# Altium schematic sheet Top_Sheet.SchDoc: =Projectname
size A4; DocumentNumber: 1; SheetNumber: 1; SheetTotal: 8
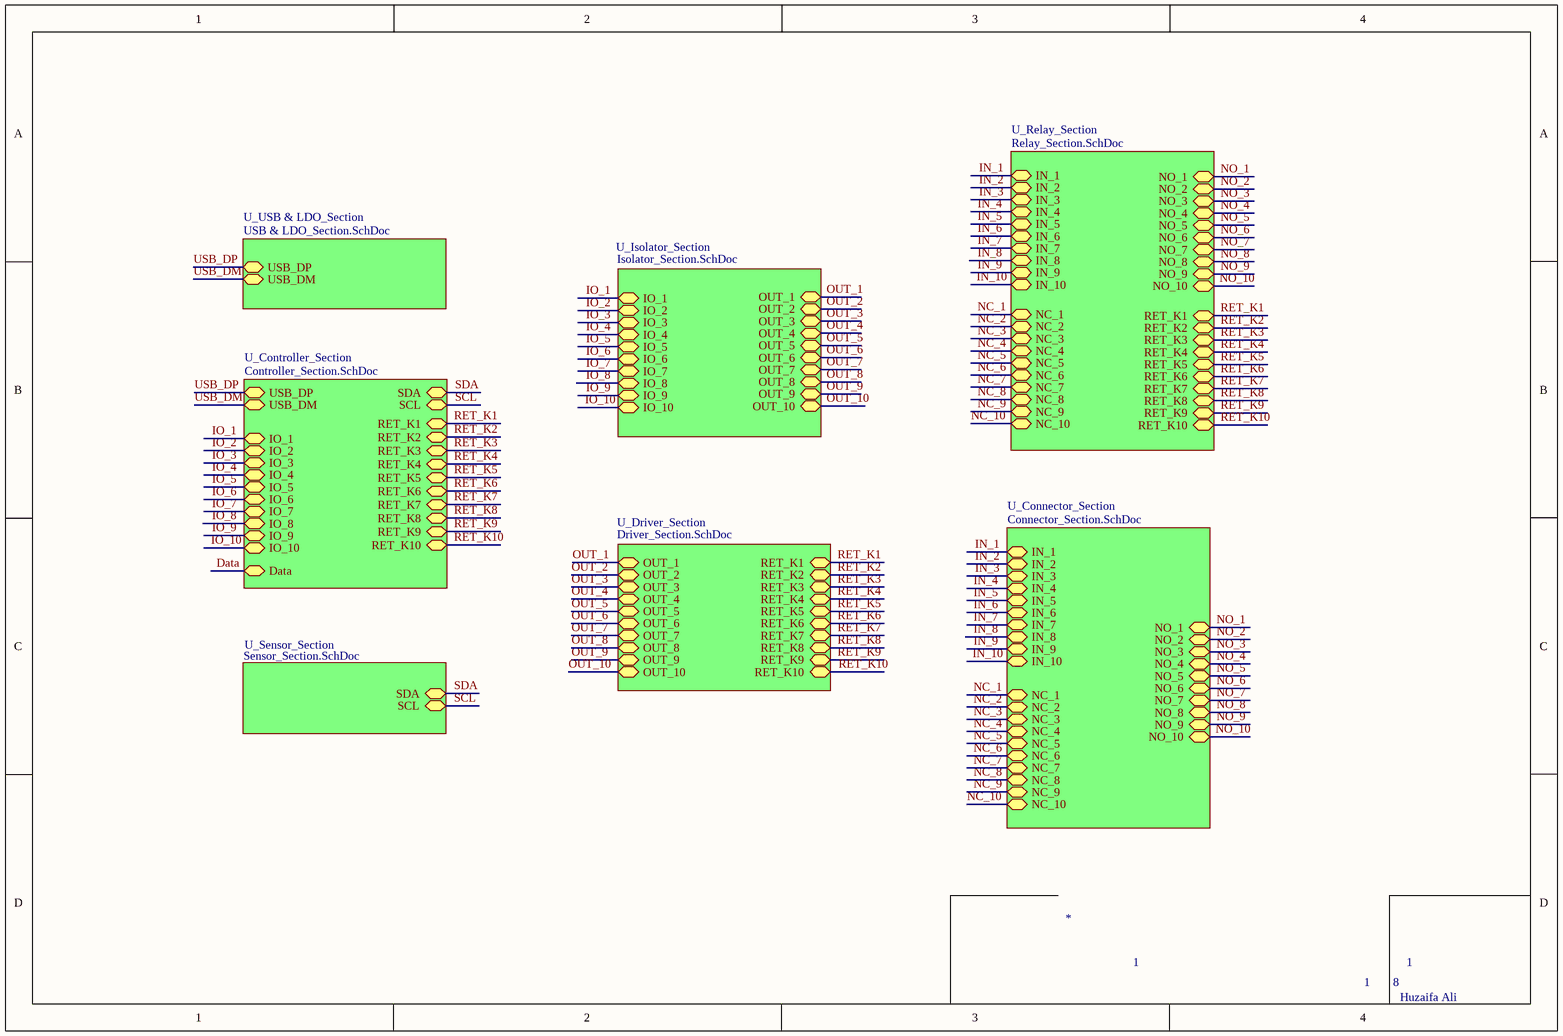
[diagram p0: Top_Sheet.SchDoc]

## Sub-sheets
U_Connector_Section = Connector_Section.SchDoc: IN_7 (bidir), NC_9 (bidir), NC_4 (bidir), NC_3 (bidir), NO_8 (bidir), NO_9 (bidir), NO_3 (bidir), IN_8 (bidir), NO_10 (bidir), NO_1 (bidir), NC_1 (bidir), NC_8 (bidir), NO_7 (bidir), IN_1 (bidir), NC_7 (bidir), NC_10 (bidir), NO_2 (bidir), IN_4 (bidir), NC_2 (bidir), NO_6 (bidir), IN_3 (bidir), IN_10 (bidir), NC_5 (bidir), IN_9 (bidir), IN_5 (bidir), NO_4 (bidir), NO_5 (bidir), IN_2 (bidir), IN_6 (bidir), NC_6 (bidir)
U_Controller_Section = Controller_Section.SchDoc: USB_DP (bidir), USB_DM (bidir), SDA (bidir), SCL (bidir), Data (bidir), IO_10 (bidir), IO_6 (bidir), IO_4 (bidir), IO_1 (bidir), IO_3 (bidir), IO_5 (bidir), IO_7 (bidir), IO_8 (bidir), IO_9 (bidir), IO_2 (bidir), RET_K10 (bidir), RET_K7 (bidir), RET_K9 (bidir), RET_K8 (bidir), RET_K2 (bidir), RET_K4 (bidir), RET_K1 (bidir), RET_K3 (bidir), RET_K6 (bidir), RET_K5 (bidir)
U_Driver_Section = Driver_Section.SchDoc: OUT_6 (bidir), OUT_7 (bidir), OUT_9 (bidir), OUT_1 (bidir), OUT_3 (bidir), OUT_8 (bidir), OUT_10 (bidir), OUT_5 (bidir), OUT_2 (bidir), OUT_4 (bidir), RET_K2 (bidir), RET_K1 (bidir), RET_K9 (bidir), RET_K10 (bidir), RET_K8 (bidir), RET_K7 (bidir), RET_K5 (bidir), RET_K6 (bidir), RET_K4 (bidir), RET_K3 (bidir)
U_Isolator_Section = Isolator_Section.SchDoc: OUT_10 (bidir), OUT_9 (bidir), OUT_6 (bidir), OUT_1 (bidir), OUT_2 (bidir), OUT_7 (bidir), OUT_8 (bidir), OUT_4 (bidir), OUT_3 (bidir), OUT_5 (bidir), IO_7 (bidir), IO_6 (bidir), IO_9 (bidir), IO_8 (bidir), IO_10 (bidir), IO_2 (bidir), IO_5 (bidir), IO_3 (bidir), IO_1 (bidir), IO_4 (bidir)
U_Relay_Section = Relay_Section.SchDoc: NO_10 (bidir), NC_8 (bidir), NC_2 (bidir), NC_10 (bidir), NC_3 (bidir), NC_4 (bidir), NC_7 (bidir), NC_9 (bidir), NC_6 (bidir), NC_5 (bidir), NO_7 (bidir), NO_8 (bidir), NO_9 (bidir), NO_6 (bidir), NC_1 (bidir), IN_1 (bidir), IN_2 (bidir), IN_3 (bidir), NO_2 (bidir), NO_1 (bidir), IN_10 (bidir), IN_9 (bidir), IN_8 (bidir), IN_7 (bidir), IN_6 (bidir), IN_5 (bidir), IN_4 (bidir), NO_3 (bidir), NO_5 (bidir), NO_4 (bidir), RET_K6 (bidir), RET_K1 (bidir), RET_K4 (bidir), RET_K3 (bidir), RET_K9 (bidir), RET_K10 (bidir), RET_K8 (bidir), RET_K2 (bidir), RET_K7 (bidir), RET_K5 (bidir)
U_Sensor_Section = Sensor_Section.SchDoc: SDA (bidir), SCL (bidir)
U_USB & LDO_Section = USB & LDO_Section.SchDoc: USB_DP (bidir), USB_DM (bidir)

## Nets
Data: sheet U_Controller_Section/Data
IN_1: sheet U_Relay_Section/IN_1, sheet U_Connector_Section/IN_1
IN_2: sheet U_Relay_Section/IN_2, sheet U_Connector_Section/IN_2
IN_3: sheet U_Relay_Section/IN_3, sheet U_Connector_Section/IN_3
IN_4: sheet U_Relay_Section/IN_4, sheet U_Connector_Section/IN_4
IN_5: sheet U_Relay_Section/IN_5, sheet U_Connector_Section/IN_5
IN_6: sheet U_Relay_Section/IN_6, sheet U_Connector_Section/IN_6
IN_7: sheet U_Relay_Section/IN_7, sheet U_Connector_Section/IN_7
IN_8: sheet U_Relay_Section/IN_8, sheet U_Connector_Section/IN_8
IN_9: sheet U_Relay_Section/IN_9, sheet U_Connector_Section/IN_9
IN_10: sheet U_Relay_Section/IN_10, sheet U_Connector_Section/IN_10
IO_1: sheet U_Controller_Section/IO_1, sheet U_Isolator_Section/IO_1
IO_2: sheet U_Controller_Section/IO_2, sheet U_Isolator_Section/IO_2
IO_3: sheet U_Controller_Section/IO_3, sheet U_Isolator_Section/IO_3
IO_4: sheet U_Controller_Section/IO_4, sheet U_Isolator_Section/IO_4
IO_5: sheet U_Controller_Section/IO_5, sheet U_Isolator_Section/IO_5
IO_6: sheet U_Controller_Section/IO_6, sheet U_Isolator_Section/IO_6
IO_7: sheet U_Controller_Section/IO_7, sheet U_Isolator_Section/IO_7
IO_8: sheet U_Controller_Section/IO_8, sheet U_Isolator_Section/IO_8
IO_9: sheet U_Controller_Section/IO_9, sheet U_Isolator_Section/IO_9
IO_10: sheet U_Controller_Section/IO_10, sheet U_Isolator_Section/IO_10
NC_1: sheet U_Relay_Section/NC_1, sheet U_Connector_Section/NC_1
NC_2: sheet U_Relay_Section/NC_2, sheet U_Connector_Section/NC_2
NC_3: sheet U_Relay_Section/NC_3, sheet U_Connector_Section/NC_3
NC_4: sheet U_Relay_Section/NC_4, sheet U_Connector_Section/NC_4
NC_5: sheet U_Relay_Section/NC_5, sheet U_Connector_Section/NC_5
NC_6: sheet U_Relay_Section/NC_6, sheet U_Connector_Section/NC_6
NC_7: sheet U_Relay_Section/NC_7, sheet U_Connector_Section/NC_7
NC_8: sheet U_Relay_Section/NC_8, sheet U_Connector_Section/NC_8
NC_9: sheet U_Relay_Section/NC_9, sheet U_Connector_Section/NC_9
NC_10: sheet U_Relay_Section/NC_10, sheet U_Connector_Section/NC_10
NO_1: sheet U_Relay_Section/NO_1, sheet U_Connector_Section/NO_1
NO_2: sheet U_Relay_Section/NO_2, sheet U_Connector_Section/NO_2
NO_3: sheet U_Relay_Section/NO_3, sheet U_Connector_Section/NO_3
NO_4: sheet U_Relay_Section/NO_4, sheet U_Connector_Section/NO_4
NO_5: sheet U_Relay_Section/NO_5, sheet U_Connector_Section/NO_5
NO_6: sheet U_Relay_Section/NO_6, sheet U_Connector_Section/NO_6
NO_7: sheet U_Relay_Section/NO_7, sheet U_Connector_Section/NO_7
NO_8: sheet U_Relay_Section/NO_8, sheet U_Connector_Section/NO_8
NO_9: sheet U_Relay_Section/NO_9, sheet U_Connector_Section/NO_9
NO_10: sheet U_Relay_Section/NO_10, sheet U_Connector_Section/NO_10
OUT_1: sheet U_Isolator_Section/OUT_1, sheet U_Driver_Section/OUT_1
OUT_2: sheet U_Isolator_Section/OUT_2, sheet U_Driver_Section/OUT_2
OUT_3: sheet U_Isolator_Section/OUT_3, sheet U_Driver_Section/OUT_3
OUT_4: sheet U_Isolator_Section/OUT_4, sheet U_Driver_Section/OUT_4
OUT_5: sheet U_Isolator_Section/OUT_5, sheet U_Driver_Section/OUT_5
OUT_6: sheet U_Isolator_Section/OUT_6, sheet U_Driver_Section/OUT_6
OUT_7: sheet U_Isolator_Section/OUT_7, sheet U_Driver_Section/OUT_7
OUT_8: sheet U_Isolator_Section/OUT_8, sheet U_Driver_Section/OUT_8
OUT_9: sheet U_Isolator_Section/OUT_9, sheet U_Driver_Section/OUT_9
OUT_10: sheet U_Isolator_Section/OUT_10, sheet U_Driver_Section/OUT_10
RET_K1: sheet U_Controller_Section/RET_K1, sheet U_Relay_Section/RET_K1, sheet U_Driver_Section/RET_K1
RET_K2: sheet U_Controller_Section/RET_K2, sheet U_Relay_Section/RET_K2, sheet U_Driver_Section/RET_K2
RET_K3: sheet U_Controller_Section/RET_K3, sheet U_Relay_Section/RET_K3, sheet U_Driver_Section/RET_K3
RET_K4: sheet U_Controller_Section/RET_K4, sheet U_Relay_Section/RET_K4, sheet U_Driver_Section/RET_K4
RET_K5: sheet U_Controller_Section/RET_K5, sheet U_Relay_Section/RET_K5, sheet U_Driver_Section/RET_K5
RET_K6: sheet U_Controller_Section/RET_K6, sheet U_Relay_Section/RET_K6, sheet U_Driver_Section/RET_K6
RET_K7: sheet U_Controller_Section/RET_K7, sheet U_Relay_Section/RET_K7, sheet U_Driver_Section/RET_K7
RET_K8: sheet U_Controller_Section/RET_K8, sheet U_Relay_Section/RET_K8, sheet U_Driver_Section/RET_K8
RET_K9: sheet U_Controller_Section/RET_K9, sheet U_Relay_Section/RET_K9, sheet U_Driver_Section/RET_K9
RET_K10: sheet U_Controller_Section/RET_K10, sheet U_Relay_Section/RET_K10, sheet U_Driver_Section/RET_K10
SCL: sheet U_Controller_Section/SCL, sheet U_Sensor_Section/SCL
SDA: sheet U_Controller_Section/SDA, sheet U_Sensor_Section/SDA
USB_DM: sheet U_USB & LDO_Section/USB_DM, sheet U_Controller_Section/USB_DM
USB_DP: sheet U_USB & LDO_Section/USB_DP, sheet U_Controller_Section/USB_DP

## Notes on the sheet
- 1
- Huzaifa Ali